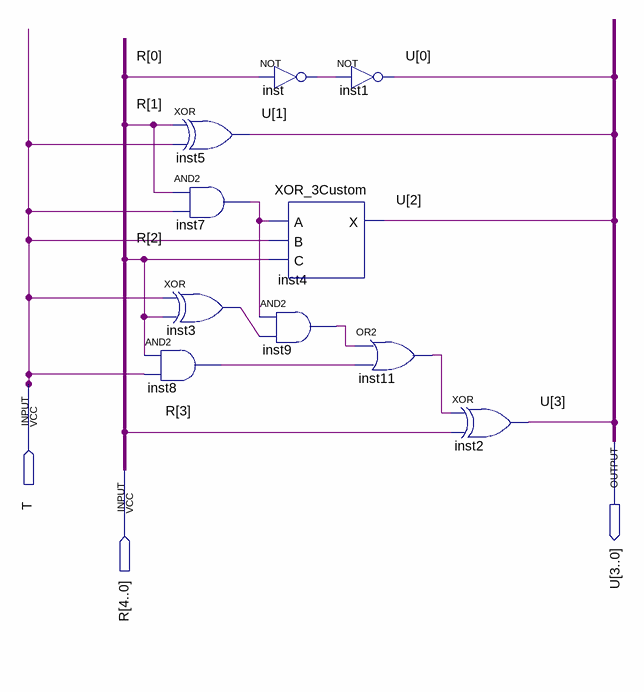
[diagram p0: schematic sheet]
// Quartus schematic UNIDADE-DP7.bdf as structural Verilog: 10 symbols, 3 pins
module \UNIDADE-DP7  (
  input  T,
  input  [4:0] R,
  output [3:0] U
);

  wire inst3_out, inst7_out, inst8_out, inst9_out, inst11_out, inst_out;

  xor inst5 (U[1], R[1], T);
  and inst7 (inst7_out, R[1], T);
  xor inst3 (inst3_out, T, R[2]);
  and inst8 (inst8_out, R[2], T);
  not inst (inst_out, R[0]);
  XOR_3Custom inst4 (.A(inst7_out), .B(T), .C(R[2]), .X(U[2]));
  and inst9 (inst9_out, inst7_out, inst3_out);
  not inst1 (U[0], inst_out);
  or inst11 (inst11_out, inst9_out, inst8_out);
  xor inst2 (U[3], inst11_out, R[3]);
endmodule
